# Altium schematic sheet DC_Sweep.SchDoc
size A4
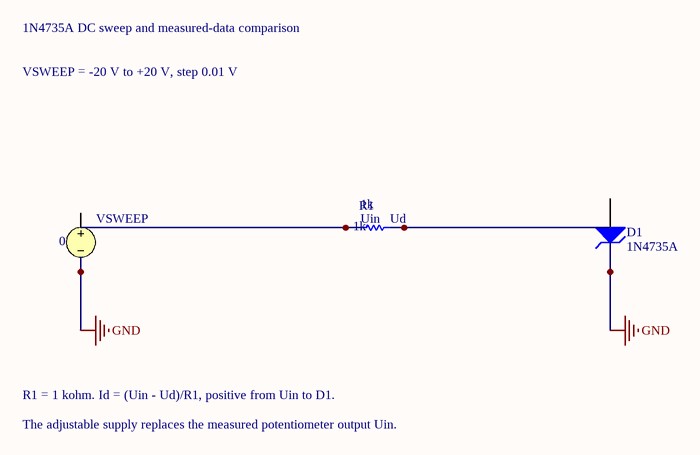
[diagram p0: DC_Sweep.SchDoc]

## Parts
D1  1N4735A  [59-03]
R1  1k  [AXIAL-0.3]
VSWEEP  0

## Nets
GND: D1.2(K) VSWEEP.2
Ud: R1.2
Uin: R1.1

Not connected (* = marked no-connect by the designer): D1 1(A); VSWEEP 1

## Notes on the sheet
- 1N4735A DC sweep and measured-data comparison
- VSWEEP = -20 V to +20 V, step 0.01 V
- R1 = 1 kohm. Id = (Uin - Ud)/R1, positive from Uin to D1.
- The adjustable supply replaces the measured potentiometer output Uin.

## Library data of the parts
D1 = 1N4735A: One Watt Hermetically Sealed Glass Silicon Zener Diode; Published: 29-Sep-2000; LatestRevisionDate: 17-Jul-2002; LatestRevisionNote: Re-released for DXP Platform.; PackageReference: 59-03; Publisher: Altium Limited; PackageDescription: Diode, Axial; Body 5.2 x 2.7 mm (LxDia. max), Lead Dia. 0.86 mm (max); Code_JEDEC: DO-204-AL; ComponentLink1Description: Manufacturer Link; ComponentLink1URL: http://www.onsemi.com/site/products/landing?taxonomyID=194; Value: 1N4735A
R1 = Res1: Resistor; Published: 8-Jun-2000; LatestRevisionDate: 17-Jul-2002; LatestRevisionNote: Re-released for DXP Platform.; PackageReference: AXIAL-0.3; Publisher: Altium Limited; Value: 1k
VSWEEP = VSRC: Voltage Source; Note: PCB Footprint - Not required; Published: 8-Jun-2000; LatestRevisionDate: 17-Jul-2002; LatestRevisionNote: Re-released for DXP Platform.; PackageReference: Not Applicable; Publisher: Altium Limited; Value: 0